# EasyEDA Pro project ProPrj_电刺激+主控_2026-05-06.epro, schematic Schematic1

## Sheets
1 主控模块: Assembly Variant: Basic; Board Name: Board1; Create Date: 2026-04-27; Page Name: P1; Project Name: 电刺激+主控; Schematic Name: Schematic1; Update Date: 2026-04-27; Company: 嘉立创EDA; Page Size: A4; Version: V1.0
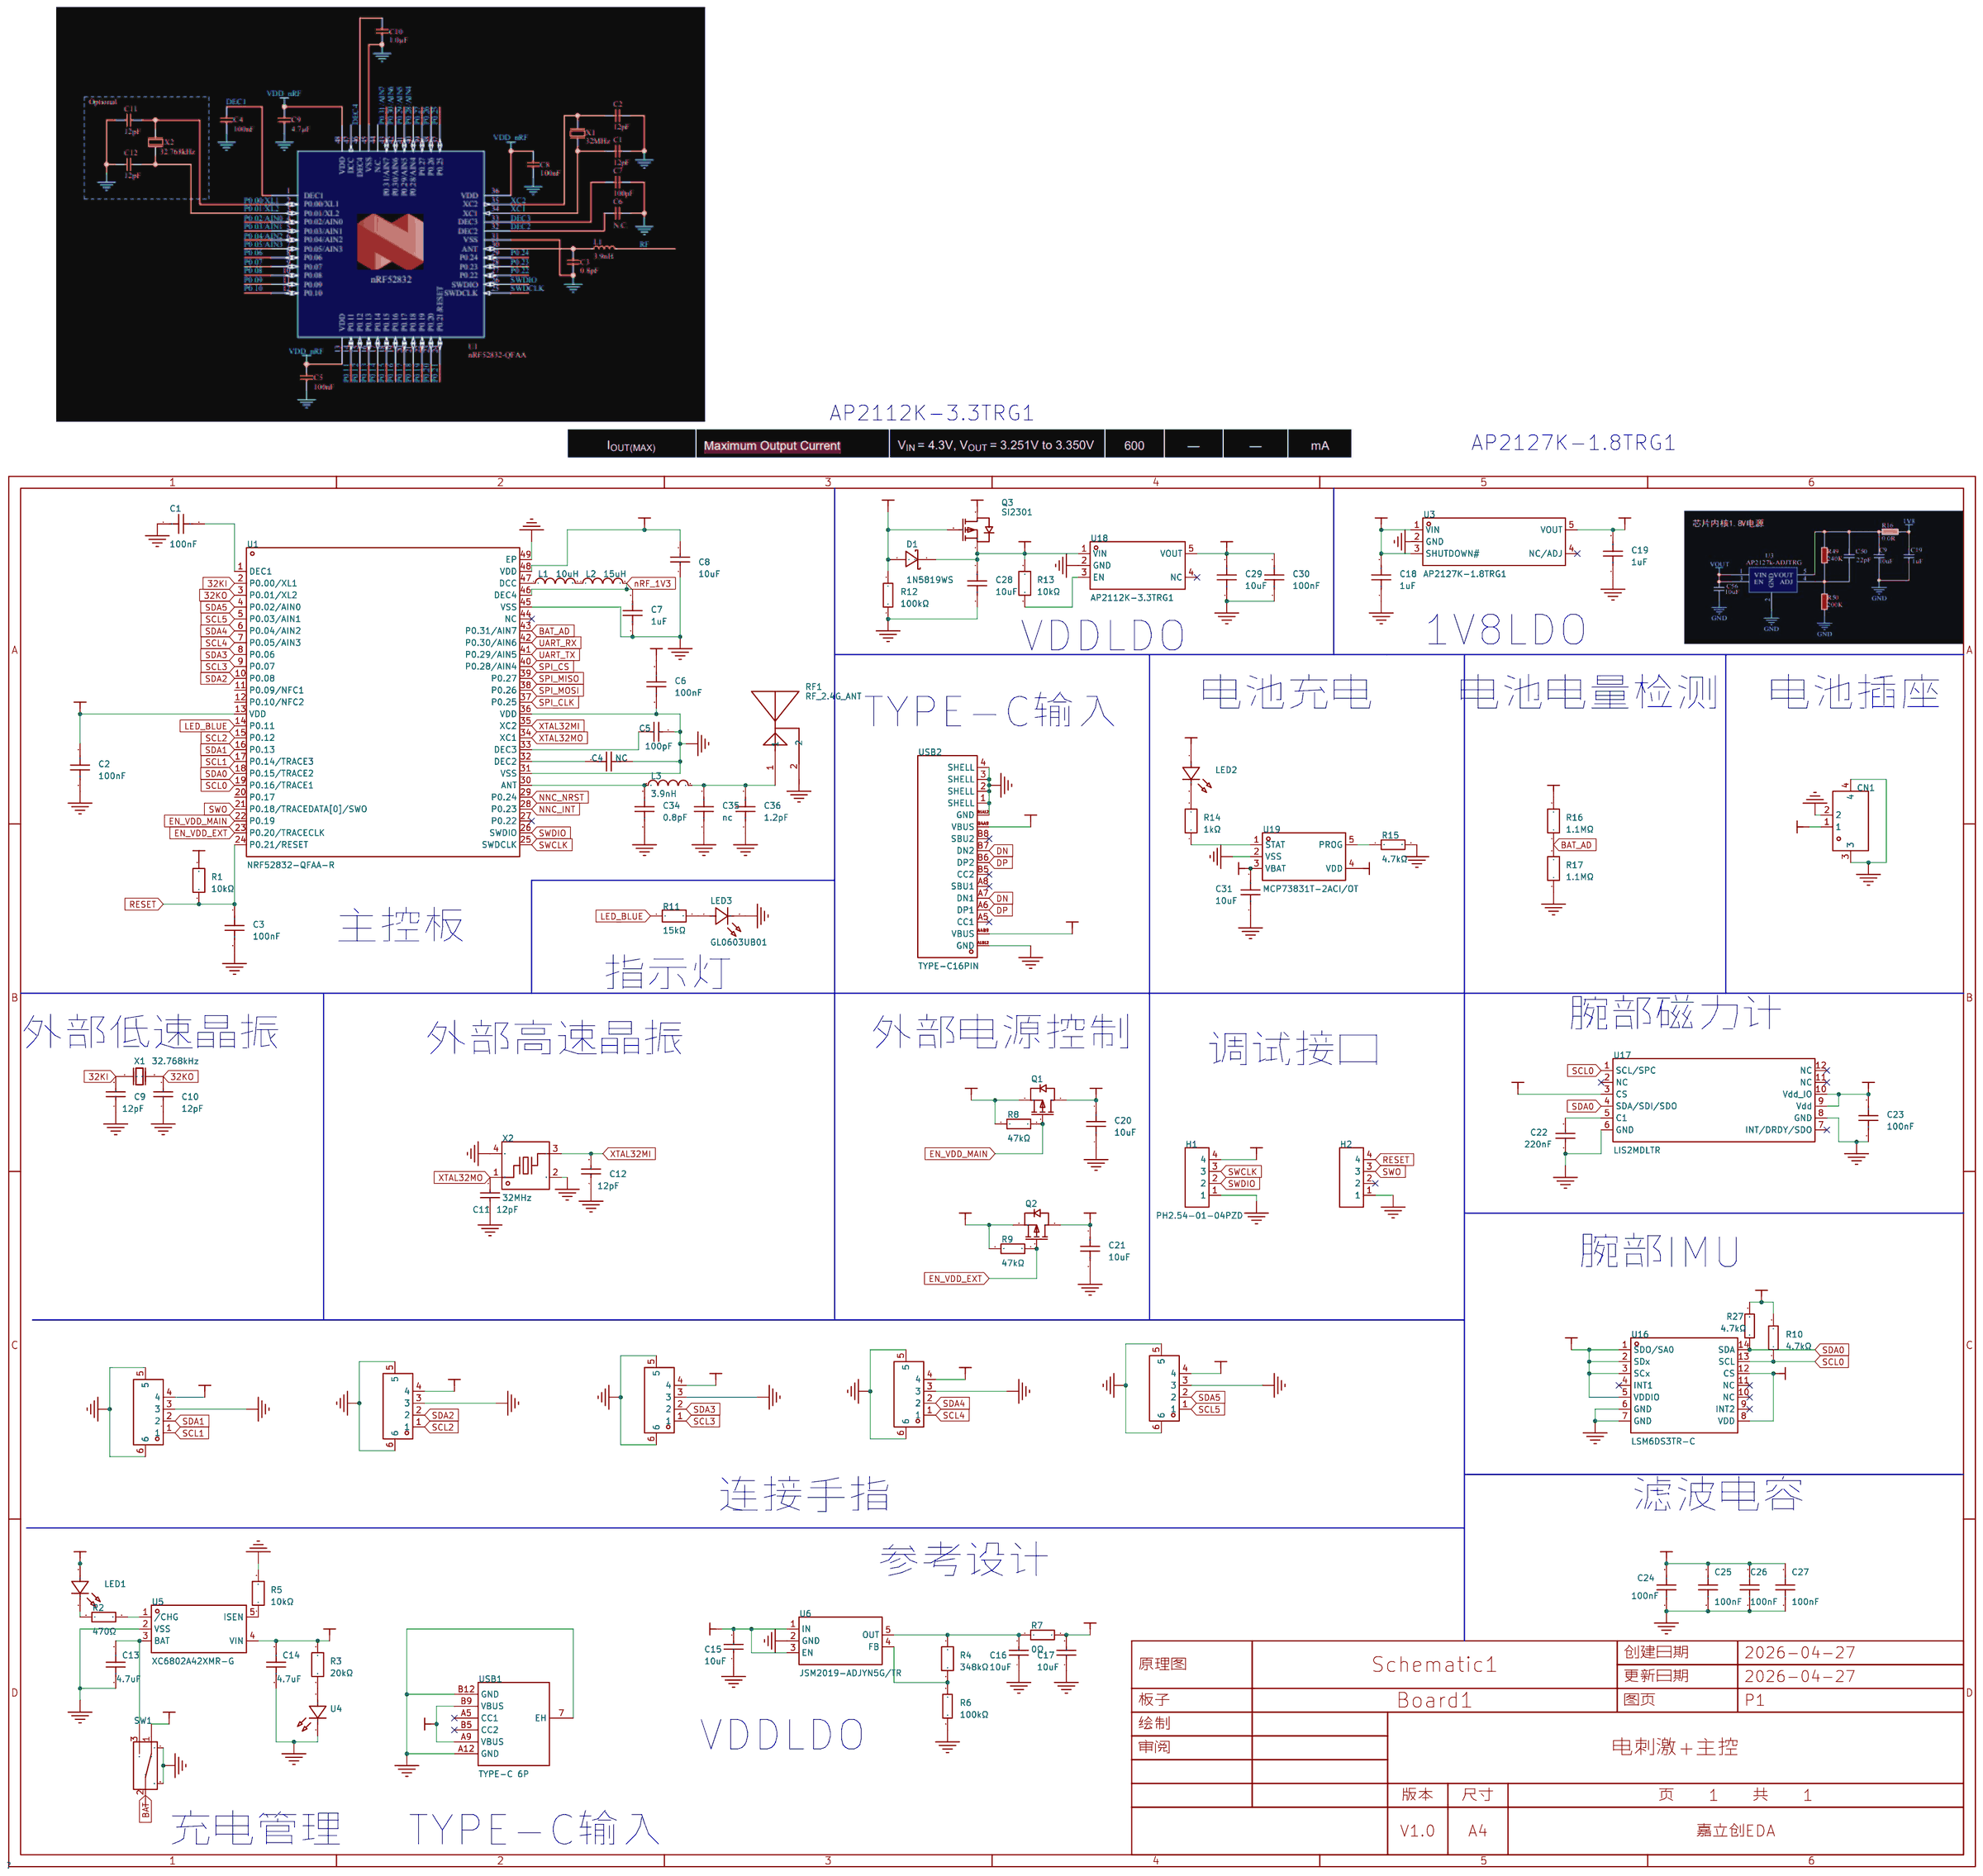
[diagram p0: 主控模块]
2 刺激模块: Page Name: P2
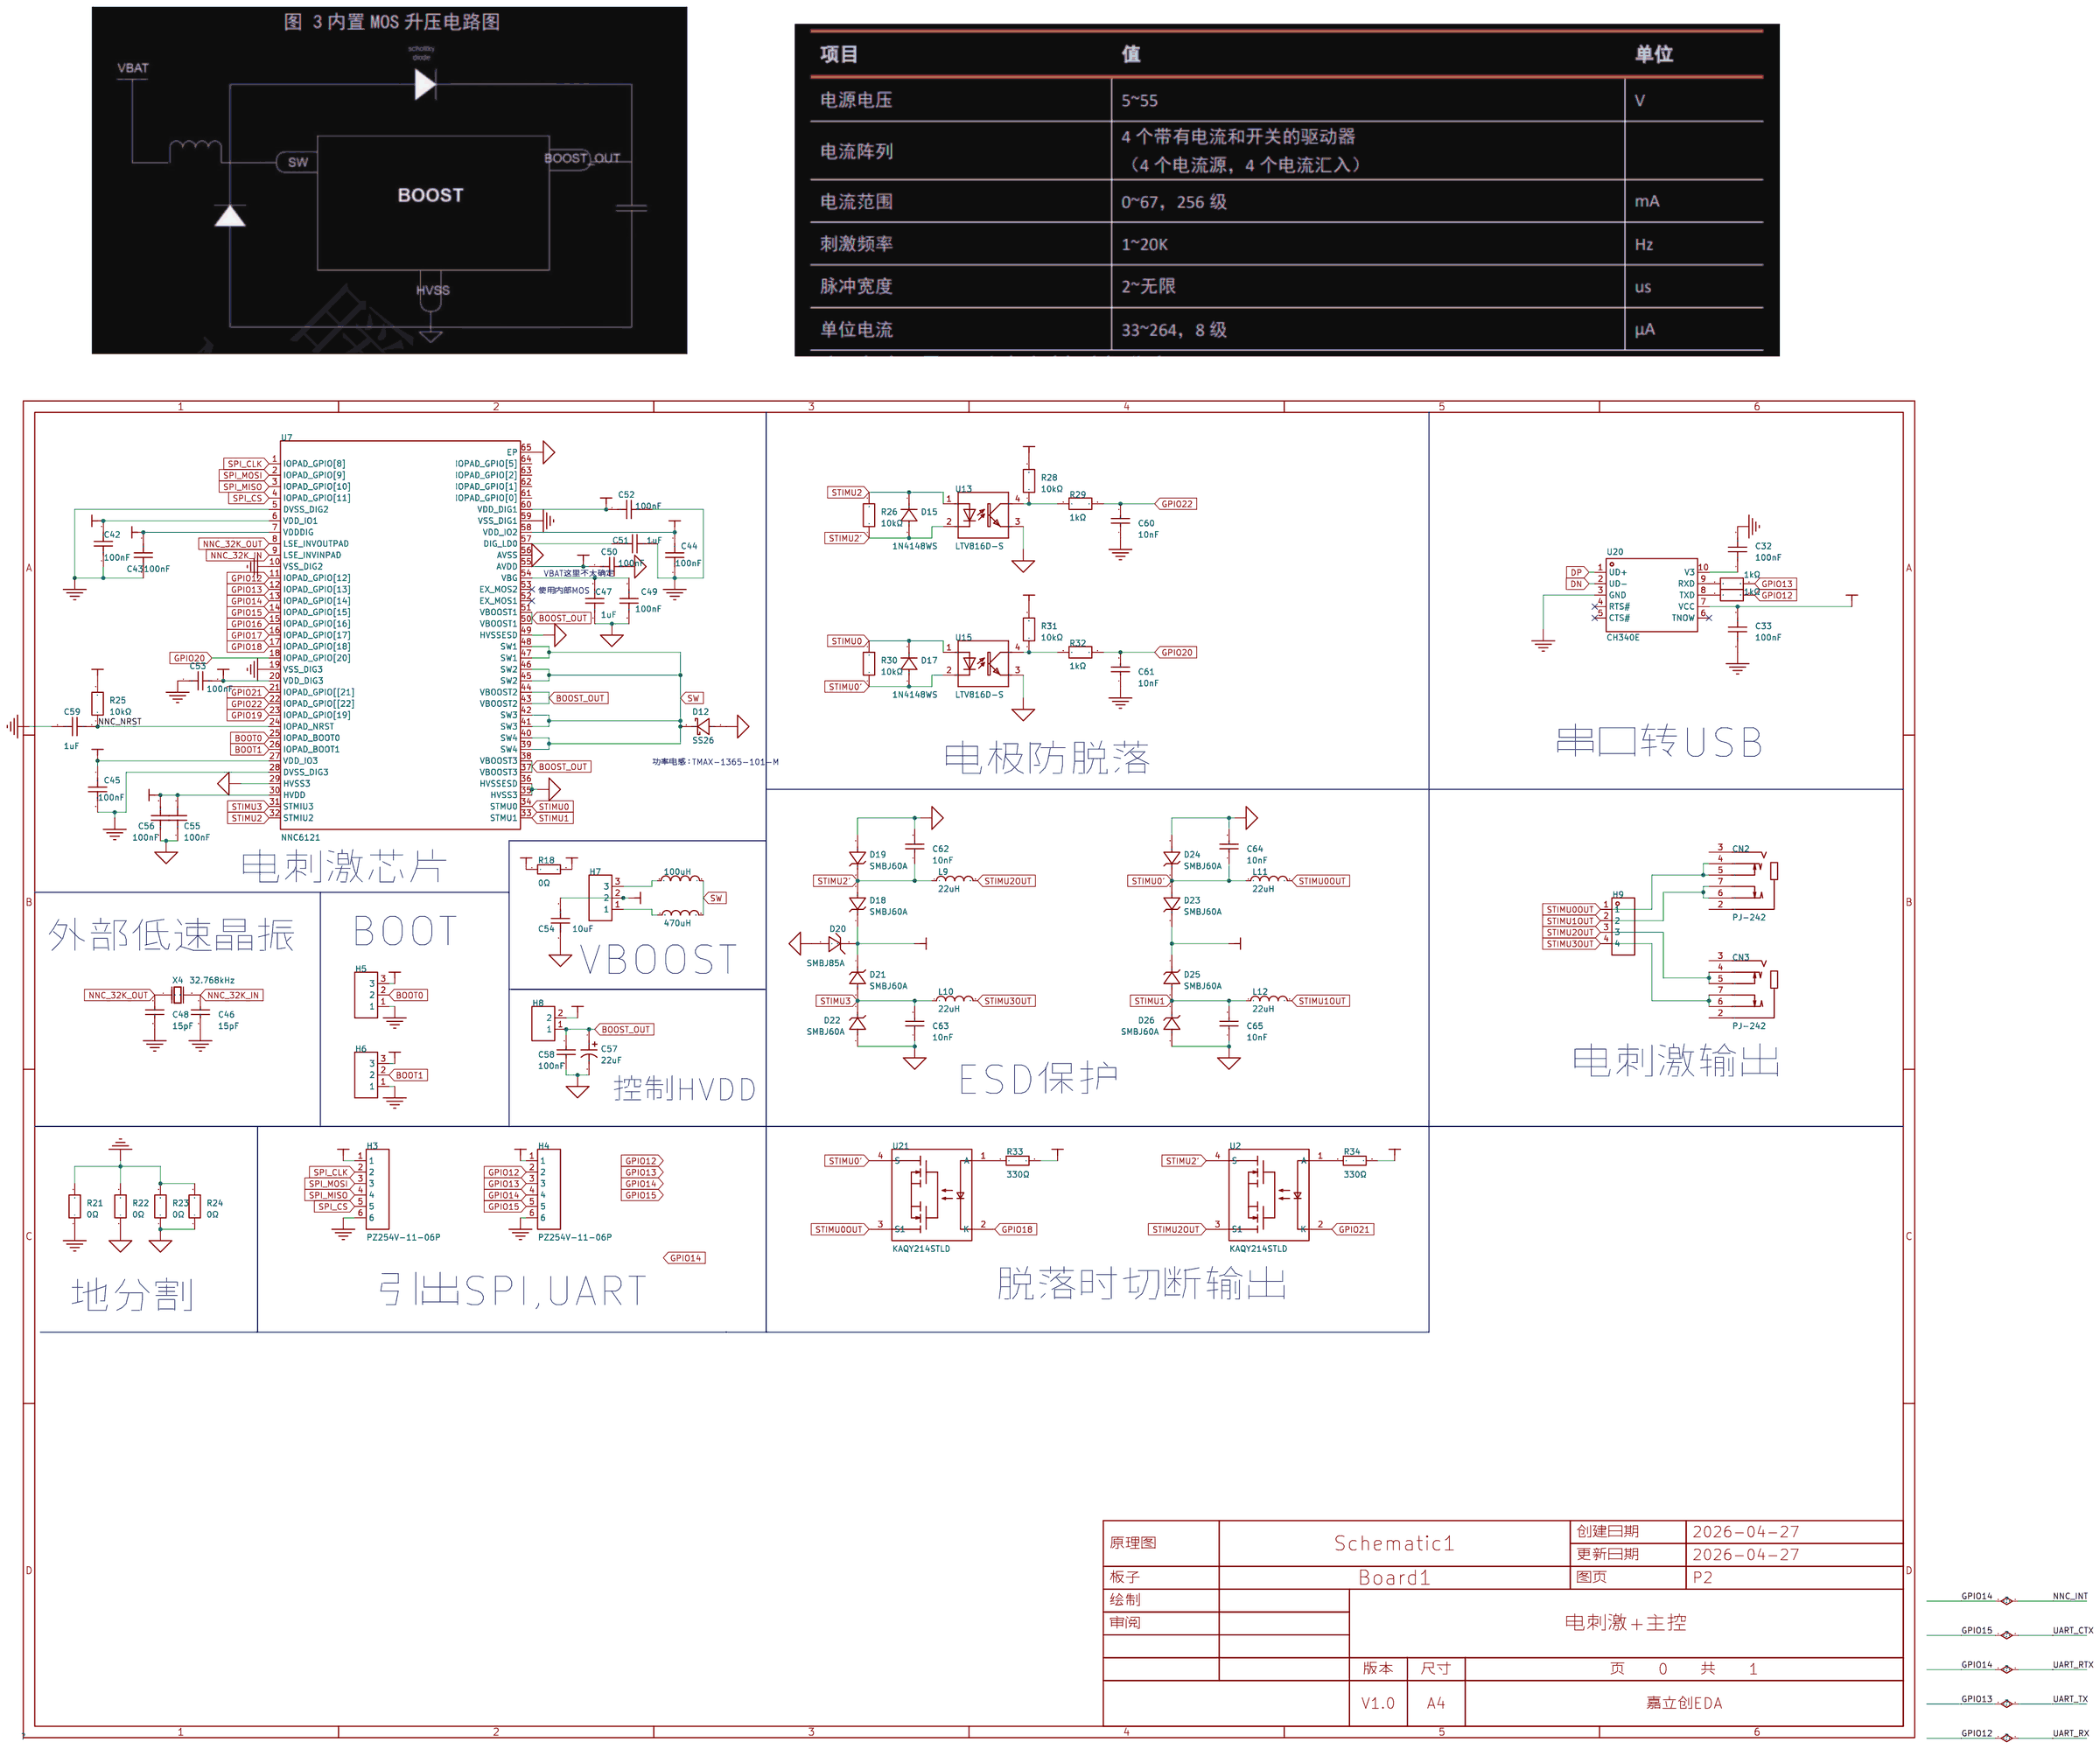
[diagram p1: 刺激模块]

## Parts
sheet 主控模块
C1  100nF  [C0402_NEW]
C2  100nF  [C0603]
C3  100nF  [C0603]
C4  NC  [C0805]
C5  100pF  [C0603]
C6  100nF  [C0603]
C7  1uF  [C0603]
C8  10uF  [C0402]
C9  12pF  [C0603]
C10  12pF  [C0603]
C11  12pF  [C0603]
C12  12pF  [C0603]
C13  4.7uF  [C0603]  (no BOM)
C14  4.7uF  [C0603]  (no BOM)
C15  10uF  [C0402]  (no BOM)
C16  10uF  [C0402]  (no BOM)
C17  10uF  [C0402]  (no BOM)
C18  1uF  [C0603]
C19  1uF  [C0603]
C20  10uF  [C0402]
C21  10uF  [C0402]
C22  220nF  [C0603]
C23  100nF  [C0603]
C24  100nF  [C0603]
C25  100nF  [C0603]
C26  100nF  [C0603]
C27  100nF  [C0603]
C28  10uF  [C0603]
C29  10uF  [C0603]
C30  100nF  [C0603]
C31  10uF  [C0603]
C34  0.8pF  [C0402]
C35  nc  [C0402]
C36  1.2pF  [C0402]
CN1  HC-1.25-2PWT  [CONN-SMD_2P-P1.25-HC-1.25-2PWT]
D1  1N5819WS  [SOD-323_L1.8-W1.3-LS2.5-RD]
H1  PH2.54-01-04PZD  [HDR-TH_4P-P2.54-V-M-1]
H2  PH2.54-01-04PZD  [HDR-TH_4P-P2.54-V-M-1]
L1  10uH  [L0603]
L2  15uH  [L0603]
L3  3.9nH  [L0402]
LED1  GL0603UR01  [LED0603-FD]  (no BOM)
LED2  GL0603UR01  [LED0603-FD]
LED3  GL0603UB01  [LED0603-RD_BLUE]
Q1  NX2301P,215  [SOT-23-3_L2.9-W1.3-P1.90-LS2.4-BR]
Q2  NX2301P,215  [SOT-23-3_L2.9-W1.3-P1.90-LS2.4-BR]
Q3  SI2301  [SOT-23-3_L2.9-W1.3-P1.90-LS2.4-BR]
R1  10kΩ  [R0603]
R2  470Ω  [R0603]  (no BOM)
R3  20kΩ  [R0603]  (no BOM)
R4  348kΩ  [R0603]  (no BOM)
R5  10kΩ  [R0603]  (no BOM)
R6  100kΩ  [R0603]  (no BOM)
R7  0Ω  [R0603]  (no BOM)
R8  47kΩ  [R0603]
R9  47kΩ  [R0603]
R10  4.7kΩ  [R0603]
R11  15kΩ  [R0603]
R12  100kΩ  [R0603]
R13  10kΩ  [R0603]
R14  1kΩ  [R0603]
R15  4.7kΩ  [R0603]
R16  1.1MΩ  [R0603]
R17  1.1MΩ  [R0603]
R27  4.7kΩ  [R0603]
RF1  RF_2.4G_ANT  [天线封装]
SW1  SS-12D02-VG4  [SW-TH_SS-12D02-VG4]  (no BOM)
U1  NRF52832-QFAA-R  [QFN-48_L6.0-W6.0-P0.40-BL-EP3.8]
U3  AP2127K-1.8TRG1  [SOT-23-5_L3.0-W1.7-P0.95-LS2.8-BR]
U4  PSC-1608U52GC-G4  [LED0603-RD_GREEN]  (no BOM)
U5  XC6802A42XMR-G  [SOT-25-5_L3.0-W1.8-P0.95-LS3.0-BL]  (no BOM)
U6  JSM2019-ADJYN5G/TR  [SOT-23-5_L2.9-W1.6-P0.95-LS2.8-BR]  (no BOM)
U8  WAFER-GH1.25-4PLB  [CONN-SMD_4P-P1.25_XUNPU_WAFER-GH1.25-4PLB]
U9  WAFER-GH1.25-4PLB  [CONN-SMD_4P-P1.25_XUNPU_WAFER-GH1.25-4PLB]
U10  WAFER-GH1.25-4PLB  [CONN-SMD_4P-P1.25_XUNPU_WAFER-GH1.25-4PLB]
U11  WAFER-GH1.25-4PLB  [CONN-SMD_4P-P1.25_XUNPU_WAFER-GH1.25-4PLB]
U14  WAFER-GH1.25-4PLB  [CONN-SMD_4P-P1.25_XUNPU_WAFER-GH1.25-4PLB]
U16  LSM6DS3TR-C  [LGA-14_L3.0-W2.5-P0.50-TL]
U17  LIS2MDLTR  [VLGA-12_L2.0-W2.0-P0.50-BL]
U18  AP2112K-3.3TRG1  [SOT-25-5_L2.9-W1.6-P0.95-LS2.8-BL]
U19  MCP73831T-2ACI/OT  [SOT-23-5_L3.0-W1.7-P0.95-LS2.8-BL]
USB1  TYPE-C 6P  [TYPE-C-SMD_TYPE-C-6P_1]  (no BOM)
USB2  TYPE-C16PIN  [USB-C-SMD_TYPE-C16PIN]
X1  32.768kHz  [OSC-SMD_2P-L3.2-W1.5]
X2  32MHz  [CRYSTAL-SMD_4P-L2.5-W2.0-BL]
sheet 刺激模块
C32  100nF  [C0603]
C33  100nF  [C0603]
C42  100nF  [C0603]
C43  100nF  [C0603]
C44  100nF  [C0603]
C45  100nF  [C0603]
C46  15pF  [C0603]
C47  1uF  [C0603]
C48  15pF  [C0603]
C49  100nF  [C0603]
C50  100nF  [C0603]
C51  1uF  [C0603]
C52  100nF  [C0603]
C53  100nF  [C0603]
C54  10uF  [C0805]
C55  100nF  [C0603]
C56  100nF  [C0603]
C57  22uF  [CAP-SMD_BD6.3-L6.6-W6.6-LS7.3-FD-H7.7]
C58  100nF  [C0805]
C59  1uF  [C0603]
C60  10nF  [C0603]
C61  10nF  [C0603]
C62  10nF  [C0603]
C63  10nF  [C0603]
C64  10nF  [C0603]
C65  10nF  [C0603]
CN2  PJ-242  [AUDIO-SMD_PJ-242_1]
CN3  PJ-242  [AUDIO-SMD_PJ-242_1]
D12  SS26  [SMA_L4.3-W2.6-LS5.0-FD]
D15  1N4148WS  [SOD-323_L1.8-W1.3-LS2.5-RD]
D17  1N4148WS  [SOD-323_L1.8-W1.3-LS2.5-RD]
D18  SMBJ60A  [SMB_L4.5-W3.7-LS5.4-RD]
D19  SMBJ60A  [SMB_L4.5-W3.7-LS5.4-RD]
D20  SMBJ85A  [SMB_L4.3-W3.6-LS5.3-RD]
D21  SMBJ60A  [SMB_L4.5-W3.7-LS5.4-RD]
D22  SMBJ60A  [SMB_L4.5-W3.7-LS5.4-RD]
D23  SMBJ60A  [SMB_L4.5-W3.7-LS5.4-RD]
D24  SMBJ60A  [SMB_L4.5-W3.7-LS5.4-RD]
D25  SMBJ60A  [SMB_L4.5-W3.7-LS5.4-RD]
D26  SMBJ60A  [SMB_L4.5-W3.7-LS5.4-RD]
H3  PZ254V-11-06P  [HDR-TH_6P-P2.54-V-M]
H4  PZ254V-11-06P  [HDR-TH_6P-P2.54-V-M]
H5  12251103CNG0S115001  [HDR-TH_3P-P2.54-V-M-1]
H6  12251103CNG0S115001  [HDR-TH_3P-P2.54-V-M-1]
H7  12251103CNG0S115001  [HDR-TH_3P-P2.54-V-M-1]
H8  PZ254V-11-02P  [HDR-TH_2P-P2.54-V-M]
H9  PZ254V-11-04P  [HDR-TH_4P-P2.54-V-M]
L8  100uH  [IND-SMD_L12.6-W13.5]
L9  22uH  [IND-SMD_L4.6-W4.1-A]
L10  22uH  [IND-SMD_L4.6-W4.1-A]
L11  22uH  [IND-SMD_L4.6-W4.1-A]
L12  22uH  [IND-SMD_L4.6-W4.1-A]
R18  0Ω  [R0603]
R19  1kΩ  [R0603]
R20  1kΩ  [R0603]
R21  0Ω  [R0805]
R22  0Ω  [R0805]
R23  0Ω  [R0805]
R24  0Ω  [R0805]
R25  10kΩ  [R0603]
R26  10kΩ  [R0603]
R28  10kΩ  [R0603]
R29  1kΩ  [R0603]
R30  10kΩ  [R0603]
R31  10kΩ  [R0603]
R32  1kΩ  [R0603]
R33  330Ω  [R0402]
R34  330Ω  [R0402]
U2  KAQY214STLD  [SOP-4_L3.9-W4.4-P2.54-LS7.0-BR]
U7  NNC6121  [QFN-64_L7.0-W7.0-P0.35-TL-EP4.0]
U12  470uH  [IND-SMD_L12.5-W12.5]
U13  LTV816D-S  [SOP-4_L6.5-W4.6-P2.54-LS10.2-BL]
U15  LTV816D-S  [SOP-4_L6.5-W4.6-P2.54-LS10.2-BL]
U20  CH340E  [MSOP-10_L3.0-W3.0-P0.50-LS5.0-BL]
U21  KAQY214STLD  [SOP-4_L3.9-W4.4-P2.54-LS7.0-BR]
X4  32.768kHz  [OSC-SMD_2P-L3.2-W1.5]

## Library data of the parts
C1-C3 C6 C23-C27 C30 C32 C33 C42-C45 C49 C50 C52 C53 = CGA0603X7R104K500JT: 容值:100nF;精度:±10%;额定电压:50V;温度系数:X7R;; LCSC Part Name: 100nF ±10% 50V; Supplier Part: C6119867; Manufacturer: HRE(芯声); Supplier Footprint: 0603; JLCPCB Part Class: Extended Part; Datasheet: https://item.szlcsc.com/datasheet/CGA0603X7R104K500JT/7062573.html; Supplier: LCSC; Tolerance: ±10%; Voltage Rating: 50V; Temperature Coefficient: X7R
C4 C54 = CGA0805X5R106K500MT: 容值:10uF;精度:±10%;额定电压:50V;温度系数:X5R;; LCSC Part Name: 10uF ±10% 50V; Supplier Part: C6119889; Manufacturer: HRE(芯声); Supplier Footprint: 0805; JLCPCB Part Class: Extended Part; Datasheet: https://item.szlcsc.com/datasheet/CGA0805X5R106K500MT/7062595.html; Supplier: LCSC; Tolerance: ±10%; Voltage Rating: 50V; Temperature Coefficient: X5R
C5 = CL10C101JB8NNNC: 容值:100pF;精度:±5%;额定电压:50V;温度系数:C0G;; LCSC Part Name: 100pF ±5% 50V; Supplier Part: C14858; Manufacturer: SAMSUNG(三星); Supplier Footprint: 0603; JLCPCB Part Class: Basic Part; Datasheet: https://item.szlcsc.com/datasheet/CL10C101JB8NNNC/15530.html; Supplier: LCSC; Tolerance: ±5%; Voltage Rating: 50V; Temperature Coefficient: C0G
C7 C18 C19 C47 C51 C59 = CGA0603X5R105K500JT: 容值:1uF;精度:±10%;额定电压:50V;温度系数:X5R;; LCSC Part Name: 1uF ±10% 50V; Supplier Part: C6119852; Manufacturer: HRE(芯声); Supplier Footprint: 0603; JLCPCB Part Class: Extended Part; Datasheet: https://item.szlcsc.com/datasheet/CGA0603X5R105K500JT/7062558.html; Supplier: LCSC; Tolerance: ±10%; Voltage Rating: 50V; Temperature Coefficient: X5R
C8 C15-C17 = CL05A106MQ5NUNC: 容值:10uF;精度:±20%;额定电压:6.3V;温度系数:X5R;; LCSC Part Name: 10uF ±20% 6.3V; Supplier Part: C15525; Manufacturer: SAMSUNG(三星); Supplier Footprint: 0402; JLCPCB Part Class: Basic Part; Datasheet: https://item.szlcsc.com/datasheet/CL05A106MQ5NUNC/16204.html; Supplier: LCSC; Tolerance: ±20%; Voltage Rating: 6.3V; Temperature Coefficient: X5R
C9-C12 = CL10C120JB8NNNC: 容值:12pF;精度:±5%;额定电压:50V;温度系数:C0G;; LCSC Part Name: 12pF ±5% 50V; Supplier Part: C38523; Manufacturer: SAMSUNG(三星); Supplier Footprint: 0603; JLCPCB Part Class: Basic Part; Datasheet: https://item.szlcsc.com/datasheet/CL10C120JB8NNNC/39506.html; Supplier: LCSC; Tolerance: ±5%; Voltage Rating: 50V; Temperature Coefficient: C0G
C13 C14 = CL10A475KO8NNNC: 容值:4.7uF;精度:±10%;额定电压:16V;温度系数:X5R;; LCSC Part Name: 4.7uF ±10% 16V; Supplier Part: C19666; Manufacturer: SAMSUNG(三星); Supplier Footprint: 0603; JLCPCB Part Class: Basic Part; Datasheet: https://item.szlcsc.com/datasheet/CL10A475KO8NNNC/20375.html; Supplier: LCSC; Tolerance: ±10%; Voltage Rating: 16V; Temperature Coefficient: X5R
C20 C21 = CGA0402X5R106M100GT: 容值:10uF;精度:±20%;额定电压:10V;温度系数:X5R;; LCSC Part Name: 10uF ±20% 10V; Supplier Part: C6119763; Manufacturer: HRE(芯声); Supplier Footprint: 0402; JLCPCB Part Class: Extended Part; Datasheet: https://item.szlcsc.com/datasheet/CGA0402X5R106M100GT/7062469.html; Supplier: LCSC; Tolerance: ±20%; Voltage Rating: 10V; Temperature Coefficient: X5R
C22 = CL10B224KA8NNNC: 容值:220nF;精度:±10%;额定电压:25V;温度系数:X7R;; LCSC Part Name: 220nF ±10% 25V; Supplier Part: C21120; Manufacturer: SAMSUNG(三星); Supplier Footprint: 0603; JLCPCB Part Class: Basic Part; Datasheet: https://item.szlcsc.com/datasheet/CL10B224KA8NNNC/21832.html; Supplier: LCSC; Tolerance: ±10%; Voltage Rating: 25V; Temperature Coefficient: X7R
C28 C29 C31 = CL10A106KP8NNNC: 容值:10uF;精度:±10%;额定电压:10V;温度系数:X5R;; LCSC Part Name: 10uF ±10% 10V; Supplier Part: C19702; Manufacturer: SAMSUNG(三星); Supplier Footprint: 0603; JLCPCB Part Class: Basic Part; Datasheet: https://item.szlcsc.com/datasheet/CL10A106KP8NNNC/20411.html; Supplier: LCSC; Tolerance: ±10%; Voltage Rating: 10V; Temperature Coefficient: X5R
C34-C36 = GJM1555C1HR80WB01D: 容值:0.8pF;额定电压:50V;温度系数:C0G;; LCSC Part Name: ±0.05pF 0.8pF 50V; Supplier Part: C88902; Manufacturer: muRata(村田); Supplier Footprint: 0402; JLCPCB Part Class: Extended Part; Datasheet: https://atta.szlcsc.com/upload/public/pdf/source/20241220/D0AFAF126C1929700C0BCD7972400352.pdf; Supplier: LCSC; Voltage Rating: 50V; Temperature Coefficient: C0G
CN1 = HC-1.25-2PWT: 插针结构:1x2P;间距:1.25mm;安装方式:卧贴;参考系列:PicoBlade(MX 1.25);总PIN数:2P;排数:1;每排PIN数:2;行距:-;额定电流:1A;触头材质:黄铜;触头镀层:锡;工作温度:-40℃~+105℃;; LCSC Part Name: 1x2P 间距:1.25mm 卧贴 系列:PicoBlade(MX 1.25); Supplier Part: C2845379; Manufacturer: HCTL(华灿天禄); Supplier Footprint: SMD,P=1.25mm,卧贴; JLCPCB Part Class: Extended Part; Datasheet: https://item.szlcsc.com/datasheet/HC-1.25-2PWT/3039060.html; Supplier: LCSC; Pins Structure: 1x2P; Pitch: 1.25mm; Mounting Type: 卧贴; Reference Series: PicoBlade(MX 1.25); Number of Pins: 2P; Number of Rows: 1; Number of PINs Per Row: 2; Current Rating: 1A; Contact Material: 黄铜; Contact Plating: 锡; Operating Temperature: -40℃~+105℃; Voltage Rating: 125V; Plastic Material: LCP; Flame Retardant Rating: UL94V-0; Supplementary Features: 辅助焊脚; Z-Height of the Board: 3.57mm; X-Length of Bottom Edge on Board (Spacing Line): 7.55mm; Y-Width of Bottom Edge on Board: 5.25mm
D1 = 1N5819WS_C191023: 正向压降(Vf):600mV@1A;直流反向耐压(Vr):40V;整流电流:1A;; LCSC Part Name: 电压:40V 电流:1A; Supplier Part: C191023; Manufacturer: Hottech(合科泰); Supplier Footprint: SOD-323; JLCPCB Part Class: Basic Part; Datasheet: https://item.szlcsc.com/datasheet/1N5819WS/213850.html; Supplier: LCSC; Voltage - Forward(Vf@If): 600mV@1A; Voltage - DC Reverse(Vr): 40V; Current - Rectified: 1A; Non-Repetitive Peak Forward Surge Current: 25A
H1 H2 = PH2.54-01-04PZD: 插针结构:1x4P;间距:2.54mm;圆针/方针:方针;安装方式:直插;排数:单排;总PIN位数:4P;配合针长度:6mm;塑高:2.5mm;端接针长度:3mm;触头材质:黄铜;工作温度:-40℃~+105℃;颜色:黑色;; LCSC Part Name: 1x4P 间距:2.54mm 方针 直插; Supplier Part: C7501582; Manufacturer: XUNPU(讯普); Supplier Footprint: 插件,P=2.54mm; JLCPCB Part Class: Extended Part; Datasheet: https://item.szlcsc.com/datasheet/PH2.54-01-04PZD/8584136.html; Supplier: LCSC; Pin Structure: 1x4P; Pitch: 2.54mm; Circluar Pins/Square Pins: 方针; Mounting Type: 直插; Number of Rows: 单排; Number of Pins: 4P; Length of Mating Pin: 6mm; Insulation Height: 2.5mm; Length of End Connection Pin: 3mm; Contact Material: 黄铜; Operating Temperature: -40℃~+105℃; Color: 黑色
L1 L2 = MLZ1608M100WT000: 电感值:10uH;精度:±20%;额定电流:-;饱和电流(Isat):90mA;直流电阻(DCR):1.05Ω;; LCSC Part Name: 10uH ±20% 90mA; Supplier Part: C76798; Manufacturer: TDK; Supplier Footprint: 0603; JLCPCB Part Class: Extended Part; Datasheet: https://item.szlcsc.com/datasheet/MLZ1608M100WT000/77925.html; Supplier: LCSC; Tolerance: ±20%; Current - Saturation (Isat): 90mA; DC Resistance(DCR): 1.05Ω; Frequency - Self Resonant: 2MHz
L3 = SDCL1005C3N9STDF: 电感值:3.9nH;精度:-;额定电流:300mA;饱和电流(Isat):-;直流电阻(DCR):200mΩ;; LCSC Part Name: ±0.3nH 3.9nH; Supplier Part: C14033; Manufacturer: Sunlord(顺络); Supplier Footprint: 0402; JLCPCB Part Class: Extended Part; Datasheet: https://item.szlcsc.com/datasheet/SDCL1005C3N9STDF/14690.html; Supplier: LCSC; Current Rating: 300mA; DC Resistance(DCR): 200mΩ; Q @ Frequency: 8@100MHz; Frequency - Self Resonant: 4GHz
LED1 LED2 = GL0603UR01: 发光颜色:红色;正向压降(Vf):2.4V;正向电流:20mA;波长:620nm~625nm;二极管配置:独立二极管;透镜颜色:无色透明透镜;发光强度:120mcd;发光角度:120°;载带方式:正贴;工作温度:-40℃~+85℃;; LCSC Part Name: 0603 红灯 高亮; Supplier Part: C51933292; Manufacturer: Guiguang light(桂光光电); Supplier Footprint: 0603; JLCPCB Part Class: Extended Part; Datasheet: https://item.szlcsc.com/datasheet/GL0603UR01/54645988.html; Supplier: LCSC; Illumination Color: 红色; Voltage - Forward(Vf): 2.4V; Forward Current: 20mA; Wavelength - Dominant: 620nm~625nm; Diode Configuration: 独立二极管; Lens Color: 无色透明透镜; Luminous Intensity: 120mcd; Viewing Angle: 120°; Mounting Style: 正贴; Operating Temperature: -40℃~+85℃
LED3 = GL0603UB01: 发光颜色:蓝色;正向压降(Vf):2.9V;正向电流:20mA;波长:460nm~469nm;二极管配置:独立二极管;透镜颜色:无色透明透镜;发光强度:72mcd;发光角度:120°;载带方式:正贴;工作温度:-40℃~+85℃;; LCSC Part Name: 0603 蓝灯 高亮; Supplier Part: C51933294; Manufacturer: Guiguang light(桂光光电); Supplier Footprint: 0603; JLCPCB Part Class: Extended Part; Datasheet: https://item.szlcsc.com/datasheet/GL0603UB01/54645990.html; Supplier: LCSC; Illumination Color: 蓝色; Voltage - Forward(Vf): 2.9V; Forward Current: 20mA; Wavelength - Dominant: 460nm~469nm; Diode Configuration: 独立二极管; Lens Color: 无色透明透镜; Luminous Intensity: 72mcd; Viewing Angle: 120°; Mounting Style: 正贴; Operating Temperature: -40℃~+85℃
Q1 Q2 = NX2301P,215: 数量:1个P沟道;漏源电压(Vdss):20V;连续漏极电流(Id):2A;导通电阻(RDS(on)):120mΩ@4.5V;耗散功率(Pd):400mW;阈值电压(Vgs(th)):1.1V@250uA;; LCSC Part Name: 1个P沟道 耐压:20V 电流:2A; Supplier Part: C191273; Manufacturer: Nexperia(安世); Supplier Footprint: SOT-23; JLCPCB Part Class: Extended Part; Datasheet: https://item.szlcsc.com/datasheet/NX2301P%252C215/214510.html; Supplier: LCSC; Number: 1个P沟道; Drain to Source Voltage: 20V; Current - Continuous Drain(Id): 2A; RDS(on): 120mΩ@4.5V; Pd - Power Dissipation: 400mW; Gate Threshold Voltage (Vgs(th)): 1.1V@250uA; Gate Charge(Qg): 6nC@4.5V; Input Capacitance(Ciss): 380pF; Reverse Transfer Capacitance (Crss@Vds): 115pF; Operating Temperature: -55℃~+150℃; Type: P沟道
Q3 = SI2301_C2891731: 数量:1个P沟道;漏源电压(Vdss):20V;连续漏极电流(Id):2.2A;导通电阻(RDS(on)):120mΩ@4.5V;耗散功率(Pd):700mW;阈值电压(Vgs(th)):1.5V@250uA;; LCSC Part Name: 1个P沟道 耐压:20V 电流:2.2A; Supplier Part: C2891731; Manufacturer: YONGYUTAI(永裕泰); Supplier Footprint: SOT-23; JLCPCB Part Class: Extended Part; Datasheet: https://item.szlcsc.com/datasheet/SI2301/3119650.html; Supplier: LCSC; Number: 1个P沟道; Drain to Source Voltage: 20V; Current - Continuous Drain(Id): 2.2A; RDS(on): 120mΩ@4.5V; Pd - Power Dissipation: 700mW; Gate Threshold Voltage (Vgs(th)): 1.5V@250uA; Input Capacitance(Ciss): 200pF@10V; Operating Temperature: -55℃~+150℃; Type: P沟道; Output Capacitance(Coss): 80pF
R1 R5 R13 R25 R26 R28 R30 R31 = FRC0603F1002TS: 电阻类型:厚膜电阻;阻值:10kΩ;精度:±1%;功率:100mW;工作电压:75V;温度系数:±100ppm/℃;; LCSC Part Name: 10kΩ ±1% 100mW 厚膜电阻; Supplier Part: C2906982; Manufacturer: FOJAN(富捷); Supplier Footprint: 0603; JLCPCB Part Class: Extended Part; Supplier: LCSC; Type: 厚膜电阻; Tolerance: ±1%; Power(Watts): 100mW; Voltage-Supply(Max): 75V; Temperature Coefficient: ±100ppm/℃; Operating Temperature: -55℃~+155℃
R2 = 0603WAF4700T5E: 电阻类型:厚膜电阻;阻值:470Ω;精度:±1%;功率:100mW;工作电压:75V;温度系数:±100ppm/℃;; LCSC Part Name: 470Ω ±1% 100mW 厚膜电阻; Supplier Part: C23179; Manufacturer: UNI-ROYAL(厚声); Supplier Footprint: 0603; JLCPCB Part Class: Basic Part; Datasheet: https://item.szlcsc.com/datasheet/0603WAF4700T5E/23906.html; Supplier: LCSC; Type: 厚膜电阻; Tolerance: ±1%; Power(Watts): 100mW; Voltage-Supply(Max): 75V; Temperature Coefficient: ±100ppm/℃; Operating Temperature: -55℃~+155℃
R3 = FRC0603F2002TS: 电阻类型:厚膜电阻;阻值:20kΩ;精度:±1%;功率:100mW;工作电压:75V;温度系数:±100ppm/℃;; LCSC Part Name: 20kΩ ±1% 100mW 厚膜电阻; Supplier Part: C2907011; Manufacturer: FOJAN(富捷); Supplier Footprint: 0603; JLCPCB Part Class: Extended Part; Supplier: LCSC; Type: 厚膜电阻; Tolerance: ±1%; Power(Watts): 100mW; Voltage-Supply(Max): 75V; Temperature Coefficient: ±100ppm/℃; Operating Temperature: -55℃~+155℃
R4 = FRC0603F3483TS: 电阻类型:厚膜电阻;阻值:348kΩ;精度:±1%;功率:100mW;工作电压:75V;温度系数:±100ppm/℃;; LCSC Part Name: 348kΩ ±1% 100mW 厚膜电阻; Supplier Part: C2930094; Manufacturer: FOJAN(富捷); Supplier Footprint: 0603; JLCPCB Part Class: Extended Part; Supplier: LCSC; Type: 厚膜电阻; Tolerance: ±1%; Power(Watts): 100mW; Voltage-Supply(Max): 75V; Temperature Coefficient: ±100ppm/℃; Operating Temperature: -55℃~+155℃
R6 R12 = 0603WAF1003T5E: 电阻类型:厚膜电阻;阻值:100kΩ;精度:±1%;功率:100mW;工作电压:75V;温度系数:±100ppm/℃;; LCSC Part Name: 100kΩ ±1% 100mW 厚膜电阻; Supplier Part: C25803; Manufacturer: UNI-ROYAL(厚声); Supplier Footprint: 0603; JLCPCB Part Class: Basic Part; Datasheet: https://item.szlcsc.com/datasheet/0603WAF1003T5E/26546.html; Supplier: LCSC; Type: 厚膜电阻; Tolerance: ±1%; Power(Watts): 100mW; Voltage-Supply(Max): 75V; Temperature Coefficient: ±100ppm/℃; Operating Temperature: -55℃~+155℃
R7 R18 = 0603WAF0000T5E: 电阻类型:厚膜电阻;阻值:0Ω;精度:±1%;功率:100mW;工作电压:75V;温度系数:-;; LCSC Part Name: 0Ω ±1% 100mW 厚膜电阻; Supplier Part: C21189; Manufacturer: UNI-ROYAL(厚声); Supplier Footprint: 0603; JLCPCB Part Class: Basic Part; Datasheet: https://item.szlcsc.com/datasheet/0603WAF0000T5E/21903.html; Supplier: LCSC; Type: 厚膜电阻; Tolerance: ±1%; Power(Watts): 100mW; Voltage-Supply(Max): 75V; Operating Temperature: -55℃~+155℃
R8 R9 = 0603WAF4702T5E: 电阻类型:厚膜电阻;阻值:47kΩ;精度:±1%;功率:100mW;工作电压:75V;温度系数:±100ppm/℃;; LCSC Part Name: 47kΩ ±1% 100mW 厚膜电阻; Supplier Part: C25819; Manufacturer: UNI-ROYAL(厚声); Supplier Footprint: 0603; JLCPCB Part Class: Basic Part; Datasheet: https://item.szlcsc.com/datasheet/0603WAF4702T5E/26562.html; Supplier: LCSC; Type: 厚膜电阻; Tolerance: ±1%; Power(Watts): 100mW; Voltage-Supply(Max): 75V; Temperature Coefficient: ±100ppm/℃; Operating Temperature: -55℃~+155℃
R10 R15 R27 = 0603WAF4701T5E: 电阻类型:厚膜电阻;阻值:4.7kΩ;精度:±1%;功率:100mW;工作电压:75V;温度系数:±100ppm/℃;; LCSC Part Name: 4.7kΩ ±1% 100mW 厚膜电阻; Supplier Part: C23162; Manufacturer: UNI-ROYAL(厚声); Supplier Footprint: 0603; JLCPCB Part Class: Basic Part; Datasheet: https://item.szlcsc.com/datasheet/0603WAF4701T5E/23889.html; Supplier: LCSC; Type: 厚膜电阻; Tolerance: ±1%; Power(Watts): 100mW; Voltage-Supply(Max): 75V; Temperature Coefficient: ±100ppm/℃; Operating Temperature: -55℃~+155℃
R11 = FRC0603F1502TS: 电阻类型:厚膜电阻;阻值:15kΩ;精度:±1%;功率:100mW;工作电压:75V;温度系数:±100ppm/℃;; LCSC Part Name: 15kΩ ±1% 100mW 厚膜电阻; Supplier Part: C2906995; Manufacturer: FOJAN(富捷); Supplier Footprint: 0603; JLCPCB Part Class: Extended Part; Supplier: LCSC; Type: 厚膜电阻; Tolerance: ±1%; Power(Watts): 100mW; Voltage-Supply(Max): 75V; Temperature Coefficient: ±100ppm/℃; Operating Temperature: -55℃~+155℃
R14 R19 R20 R29 R32 = FRC0603F1001TS: 电阻类型:厚膜电阻;阻值:1kΩ;精度:±1%;功率:100mW;工作电压:75V;温度系数:±100ppm/℃;; LCSC Part Name: 1kΩ ±1% 100mW 厚膜电阻; Supplier Part: C2907002; Manufacturer: FOJAN(富捷); Supplier Footprint: 0603; JLCPCB Part Class: Extended Part; Supplier: LCSC; Type: 厚膜电阻; Tolerance: ±1%; Power(Watts): 100mW; Voltage-Supply(Max): 75V; Temperature Coefficient: ±100ppm/℃; Operating Temperature: -55℃~+155℃
R16 R17 = FRC0603F1104TS: 电阻类型:厚膜电阻;阻值:1.1MΩ;精度:±1%;功率:100mW;工作电压:75V;温度系数:±100ppm/℃;; LCSC Part Name: 1.1MΩ ±1% 100mW 厚膜电阻; Supplier Part: C2930138; Manufacturer: FOJAN(富捷); Supplier Footprint: 0603; JLCPCB Part Class: Extended Part; Supplier: LCSC; Type: 厚膜电阻; Tolerance: ±1%; Power(Watts): 100mW; Voltage-Supply(Max): 75V; Temperature Coefficient: ±100ppm/℃; Operating Temperature: -55℃~+155℃
RF1 = RF_2.4G_ANT
SW1 = SS-12D02-VG4_C136719: 电路结构:单刀双掷;安装方式:直插;额定电流:-;额定电压:-;工作寿命:5千次;; LCSC Part Name: 直插双档 滑动开关; Supplier Part: C136719; Manufacturer: 韩国韩荣; Supplier Footprint: 插件; JLCPCB Part Class: Extended Part; Datasheet: https://item.szlcsc.com/datasheet/SS-12D02-VG4/148035.html; Supplier: LCSC; Circuit: 单刀双掷; Actuator Style: 矩形柱状; Termination Style: PC引脚; Switch Height: 8.7mm; Mounting Type: 直插; Life: 5千次; Operating Temperature: -25℃~+70℃
U1 = NRF52832-QFAA-R: 频率范围:-;接口类型:I2C；UART；SPI;应用领域:IoT；蓝牙;数据速率:2Mbps;灵敏度:-96dBm;典型应用频率:2.4GHz;; LCSC Part Name: 2.4 GHz收发器，蓝牙低功耗模式; Supplier Part: C77540; Manufacturer: NORDIC; Supplier Footprint: QFN-48-EP(6x6); JLCPCB Part Class: Extended Part; Datasheet: https://item.szlcsc.com/datasheet/NRF52832-QFAA-R/78669.html; Supplier: LCSC; Interface: I2C；UART；SPI; Voltage - Supply: 1.7V~3.6V; Applications: IoT；蓝牙; Output Power: 4dBm; Data Rate: 2Mbps; Current Of Transmitting: 5.3mA; Sensitivity: -96dBm; Receive Current: 5.4mA; Typical Application Frequency: 2.4GHz; Operating Temperature: -40℃~+85℃; Type: 收发器
U3 = AP2127K-1.8TRG1: 输出类型:固定;工作电压:6V;输出电压:1.8V;输出电流:300mA;电源纹波抑制比(PSRR):68dB@(1kHz);输出极性:正极;; LCSC Part Name: 输入6V 输出1.8V~1.8V 300mA; Supplier Part: C151375; Manufacturer: DIODES(美台); Supplier Footprint: SOT-23-5; JLCPCB Part Class: Extended Part; Datasheet: https://item.szlcsc.com/datasheet/AP2127K-1.8TRG1/162715.html; Supplier: LCSC; Output Type: 固定; Voltage - Supply: 6V; Output Voltage: 1.8V; Output Current: 300mA; Power Supply Rejection Ratio (PSRR): 68dB@(1kHz); Voltage Dropout: 600mV@(300mA); standby current: 60uA; Noise: 60uVrms; Features: 过流保护；带使能；过热保护; Operating Temperature: -40℃~+85℃@(Ta); Output Configuration: 正极; Number of Outputs: 1
U4 = PSC-1608U52GC-G4: 发光颜色:绿色;正向压降(Vf):3.1V;功率:66mW;正向电流:10mA;波长:517nm~527nm;透镜颜色:无色透明透镜;发光强度:780mcd;发光角度:130°;工作温度:-40℃~+85℃;; LCSC Part Name: 钻孔1608低亮绿灯; Supplier Part: C22371297; Manufacturer: HONGLITRONIC(鸿利光电); Supplier Footprint: 0603; JLCPCB Part Class: Extended Part; Datasheet: https://item.szlcsc.com/datasheet/PSC-1608U52GC-G4/23857064.html; Supplier: LCSC; Illumination Color: 绿色; Voltage - Forward(Vf): 3.1V; Power(Watts): 66mW; Forward Current: 10mA; Wavelength - Dominant: 517nm~527nm; Lens Color: 无色透明透镜; Luminous Intensity: 780mcd; Viewing Angle: 130°; Operating Temperature: -40℃~+85℃
U5 = XC6802A42XMR-G: 工作电压:4.25V~6V;最大充电电流:800mA;电池类型:锂电池;电池节数:1;; LCSC Part Name: 800mA单节锂离子和锂聚合物电池线性充电器IC，恒流/恒压; Supplier Part: C160463; Manufacturer: TOREX(特瑞仕); Supplier Footprint: SOT-25; JLCPCB Part Class: Extended Part; Datasheet: https://item.szlcsc.com/datasheet/XC6802A42XMR-G/171843.html; Supplier: LCSC; The Chip Type: 充电芯片; Voltage - Supply: 4.25V~6V; Charge Current - Max: 800mA; Charging Saturation Voltage: 4.2V; Type of Battery: 锂电池; Number of Cells: 1; Operating Temperature: -40℃~+85℃; Battery Temperature Detection: 不支持; Supply Current (Iq): 15uA
U6 = JSM2019-ADJYN5G/TR: 输出类型:可调;工作电压:5.5V;输出电流:300mA;电源纹波抑制比(PSRR):80dB@(100Hz);输出极性:正极;; LCSC Part Name: 300mA 5.5V; Supplier Part: C22447123; Manufacturer: JSMSEMI(杰盛微); Supplier Footprint: SOT-23-5; JLCPCB Part Class: Extended Part; Datasheet: https://item.szlcsc.com/datasheet/JSM2019-ADJYN5G%252FTR/24102045.html; Supplier: LCSC; Output Type: 可调; Voltage - Supply: 5.5V; Output Current: 300mA; Power Supply Rejection Ratio (PSRR): 80dB@(100Hz); standby current: 2uA; Features: 过流保护；热关断; Operating Temperature: -40℃~+85℃@(Ta); Output Configuration: 正极; Number of Outputs: 1
U8-U11 U14 = WAFER-GH1.25-4PLB: 插针结构:1x4P;间距:1.25mm;安装方式:立贴;参考系列:GH;总PIN数:4P;排数:1;每排PIN数:4;行距:-;额定电流:1A;触头材质:黄铜;触头镀层:锡;工作温度:-25℃~+85℃;; LCSC Part Name: 1x4P 间距:1.25mm 立贴 系列:GH; Supplier Part: C3029370; Manufacturer: XUNPU(讯普); Supplier Footprint: SMD,P=1.25mm; JLCPCB Part Class: Extended Part; Datasheet: https://item.szlcsc.com/datasheet/WAFER-GH1.25-4PLB/3561382.html; Supplier: LCSC; Pins Structure: 1x4P; Pitch: 1.25mm; Mounting Type: 立贴; Reference Series: GH; Number of Pins: 4P; Number of Rows: 1; Number of PINs Per Row: 4; Current Rating: 1A; Contact Material: 黄铜; Contact Plating: 锡; Operating Temperature: -25℃~+85℃; Voltage Rating: 125V; Plastic Material: LCP; Supplementary Features: 辅助焊脚; Color: 米色; Z-Height of the Board: 4.2mm; X-Length of Bottom Edge on Board (Spacing Line): 8.25mm; Y-Width of Bottom Edge on Board: 4.95mm
U16 = LSM6DS3TR-C: 传感器类型:加速度计陀螺仪;接口类型:I2C；SPI;; LCSC Part Name: IMU-惯性测量单元; Supplier Part: C967633; Manufacturer: ST(意法半导体); Supplier Footprint: LGA-14(2.5x3); JLCPCB Part Class: Extended Part; Datasheet: https://item.szlcsc.com/datasheet/LSM6DS3TR-C/1054343.html; Supplier: LCSC; Accelerometer Sensing Axis: X,Y,Z; Acceleration Measurement Range (MAX): ±16g; Gyroscope Sensing Axis: X,Y,Z; Gyroscope Measurement Range (MAX): ±2000dps; Sensor Type: 加速度计陀螺仪; Interface: I2C；SPI; Voltage - Supply: 1.71V~3.6V; Cache Size: 4KB; Operating Temperature: -40℃~+85℃
U17 = LIS2MDLTR: 磁传感器、数字输出、50高斯磁场动态范围、超低功耗、高性能、3轴磁力计; LCSC Part Name: 霍尔效应开关; Supplier Part: C919695; Manufacturer: ST(意法半导体); Supplier Footprint: LGA-12(2x2); JLCPCB Part Class: Extended Part; Datasheet: https://item.szlcsc.com/datasheet/LIS2MDLTR/998419.html; Supplier: LCSC; Magnetic Sensing Range(X,Y): ±5mT; Magnetic Sensing Range(Z): ±5mT; Output bit: 16bit; Interface Type: SPI；I2C; Voltage - Supply: 1.71V~3.6V; Current - Supply: 200uA; Operating Temperature: -40℃~+85℃
U18 = AP2112K-3.3TRG1: 输出类型:固定;工作电压:6V;输出电压:3.3V;输出电流:600mA;电源纹波抑制比(PSRR):65dB@(1kHz);输出极性:正极;; LCSC Part Name: 输入6V 输出3.3V 600mA; Supplier Part: C51118; Manufacturer: DIODES(美台); Supplier Footprint: SOT-25-5; JLCPCB Part Class: Extended Part; Datasheet: https://item.szlcsc.com/datasheet/AP2112K-3.3TRG1/52131.html; Supplier: LCSC; Output Type: 固定; Voltage - Supply: 6V; Output Voltage: 3.3V; Output Current: 600mA; Power Supply Rejection Ratio (PSRR): 65dB@(1kHz); Voltage Dropout: 250mV@(600mA); standby current: 55uA; Noise: 50uVrms; Features: 带使能；过热保护；过流保护; Operating Temperature: -40℃~+85℃@(Ta); Output Configuration: 正极; Number of Outputs: 1
U19 = MCP73831T-2ACI/OT: 工作电压:3.75V~6V;最大充电电流:550mA;电池类型:锂电池;电池节数:1;; LCSC Part Name: 单节锂离子/锂聚合物充电管理控制器; Supplier Part: C424093; Manufacturer: MICROCHIP(美国微芯); Supplier Footprint: SOT-23-5; JLCPCB Part Class: Extended Part; Datasheet: https://item.szlcsc.com/datasheet/MCP73831T-2ACI%252FOT/417116.html; Supplier: LCSC; The Chip Type: 充电芯片; Voltage - Supply: 3.75V~6V; Charge Current - Max: 550mA; Charging Saturation Voltage: 4.2V; Type of Battery: 锂电池; Number of Cells: 1; Operating Temperature: -40℃~+85℃; Battery Temperature Detection: 不支持; Supply Current (Iq): 53uA
USB1 = TYPE-C 6P: 连接器类型:Type-C;协议标准:-;公母:母;安装方式:卧贴;触点数量:6P;端口数量:1;额定电流 - 电源:3A;工作温度:-40℃~+85℃;; LCSC Part Name: 6P卧贴母座; Supplier Part: C456012; Manufacturer: SHOU HAN(首韩); Supplier Footprint: SMD; JLCPCB Part Class: Extended Part; Datasheet: https://item.szlcsc.com/datasheet/TYPE-C%25206P/458819.html; Supplier: LCSC; Connector Type: Type-C; Gender: 母; Mounting Type: 卧贴; Number of Contacts: 6P; Number of Ports: 1; Current Rating-Power: 3A; Voltage Rating: 5V; Connect-Disconnect Life: 3千次; Detection color: 黑色; Operating Temperature: -40℃~+85℃
USB2 = TYPE-C16PIN: 连接器类型:Type-C;协议标准:-;公母:母;安装方式:卧贴;触点数量:16P;端口数量:1;额定电流 - 电源:3A;工作温度:-40℃~+85℃;; LCSC Part Name: 16P卧贴母座; Supplier Part: C393939; Manufacturer: SHOU HAN(首韩); Supplier Footprint: SMD; JLCPCB Part Class: Extended Part; Datasheet: https://item.szlcsc.com/datasheet/TYPE-C16PIN/372551.html; Supplier: LCSC; Connector Type: Type-C; Gender: 母; Mounting Type: 卧贴; Number of Contacts: 16P; Number of Ports: 1; Current Rating-Power: 3A; Voltage Rating: 30V; Connect-Disconnect Life: 1万次; Detection color: 黑色; Operating Temperature: -40℃~+85℃
X1 X4 = CM315D32768DZFT: 晶振类型:-;频率:32.768kHz;常温频差:±20ppm;外接负载电容:12.5pF;; LCSC Part Name: 32.768kHz ±20ppm 12.5pF; Supplier Part: C182057; Manufacturer: CITIZEN; Supplier Footprint: SMD3215-2P; JLCPCB Part Class: Extended Part; Datasheet: https://atta.szlcsc.com/upload/public/pdf/source/20180224/C182057_15194369676281363999.pdf; Supplier: LCSC; Normal temperature Frequency Tolerance: ±20ppm; External load capacitor: 12.5pF; Equivalent Series Resistance (ESR): 70kΩ; Operating Temperature: -40℃~+85℃
X2 = S2232000121040: 晶振类型:贴片晶振;频率:32MHz;常温频差:±10ppm;负载电容:12pF;; LCSC Part Name: 32MHz ±10ppm 12pF; Supplier Part: C1508946; Manufacturer: JGHC(晶光华); Supplier Footprint: SMD2520-4P; JLCPCB Part Class: Extended Part; Datasheet: https://atta.szlcsc.com/upload/public/pdf/source/20200102/C479187_D94AAA14F8877AC0B7C204DEF1552113.pdf; Supplier: LCSC; Crystal Type: 贴片晶振; Normal temperature Frequency Tolerance: ±10ppm; Load Capacitor: 12pF; Equivalent Series Resistance (ESR): 40Ω; Operating Temperature: -40℃~+85℃
C46 C48 = CL10C150JB8NNNC: 容值:15pF;精度:±5%;额定电压:50V;温度系数:C0G;; LCSC Part Name: 15pF ±5% 50V; Supplier Part: C1644; Manufacturer: SAMSUNG(三星); Supplier Footprint: 0603; JLCPCB Part Class: Basic Part; Datasheet: https://item.szlcsc.com/datasheet/CL10C150JB8NNNC/1996.html; Supplier: LCSC; Tolerance: ±5%; Voltage Rating: 50V; Temperature Coefficient: C0G
C55 C56 = CL10B104KC8NNNC: 容值:100nF;精度:±10%;额定电压:100V;温度系数:X7R;; LCSC Part Name: 100nF ±10% 100V; Supplier Part: C15725; Manufacturer: SAMSUNG(三星); Supplier Footprint: 0603; JLCPCB Part Class: Extended Part; Datasheet: https://item.szlcsc.com/datasheet/CL10B104KC8NNNC/16407.html; Supplier: LCSC; Tolerance: ±10%; Voltage Rating: 100V; Temperature Coefficient: X7R
C57 = JVJ100V22M6x8: 容值:22uF;精度:±20%;额定电压:100V;纹波电流:60mA@120Hz;; LCSC Part Name: 22uF ±20% 100V; Supplier Part: C46550391; Manufacturer: JIERR(捷而瑞); Supplier Footprint: SMD,D6.3xL7.7mm; JLCPCB Part Class: Extended Part; Datasheet: https://item.szlcsc.com/datasheet/JVJ100V22M6x8/48680085.html; Supplier: LCSC; Tolerance: ±20%; Voltage Rating: 100V; Ripple Current: 60mA@120Hz; Diameter: 6.3mm; Height - Seated (Max): 7.7mm; Lifetime: 2000hrs@105℃; Operating Temperature: -55℃~+105℃
C58 = CL21B104KCFNNNE: 容值:100nF;精度:±10%;额定电压:100V;温度系数:X7R;; LCSC Part Name: 100nF ±10% 100V; Supplier Part: C28233; Manufacturer: SAMSUNG(三星); Supplier Footprint: 0805; JLCPCB Part Class: Basic Part; Datasheet: https://item.szlcsc.com/datasheet/CL21B104KCFNNNE/28983.html; Supplier: LCSC; Tolerance: ±10%; Voltage Rating: 100V; Temperature Coefficient: X7R
C60-C65 = CC0603KRX7R9BB103: 容值:10nF;精度:±10%;额定电压:50V;温度系数:X7R;; LCSC Part Name: 10nF ±10% 50V; Supplier Part: C100042; Manufacturer: YAGEO(国巨); Supplier Footprint: 0603; JLCPCB Part Class: Extended Part; Datasheet: https://item.szlcsc.com/datasheet/CC0603KRX7R9BB103/101256.html; Supplier: LCSC; Tolerance: ±10%; Voltage Rating: 50V; Temperature Coefficient: X7R
CN2 CN3 = PJ-242_C431536: 连接器类型:2.5mm耳机座;额定电流:500mA;额定电压:30V;触头材质:铜;触头镀层:-;工作温度:-;; LCSC Part Name: PJ-242-6P双柱镀金散装; Supplier Part: C431536; Manufacturer: SHOU HAN(首韩); Supplier Footprint: SMD; JLCPCB Part Class: Extended Part; Datasheet: https://item.szlcsc.com/datasheet/PJ-242/427893.html; Supplier: LCSC; Connector Type: 2.5mm耳机座; Current Rating: 500mA; Voltage Rating (Max): 30V; Contact Material: 铜
D12 = SS26_C7420363: 二极管配置:独立式;正向压降(Vf):700mV@2A;直流反向耐压(Vr):60V;整流电流:2A;; LCSC Part Name: 电压:60V 电流:2A; Supplier Part: C7420363; Manufacturer: R+O(宏嘉诚); Supplier Footprint: SMA(DO-214AC); JLCPCB Part Class: Extended Part; Datasheet: https://item.szlcsc.com/datasheet/SS26/8397185.html; Supplier: LCSC; Diode Configuration: 独立式; Voltage - Forward(Vf@If): 700mV@2A; Voltage - DC Reverse(Vr): 60V; Current - Rectified: 2A; Reverse Leakage Current (Ir): 200uA@60V; Operating Junction Temperature Range: -55℃~+150℃; Non-Repetitive Peak Forward Surge Current: 50A
D15 D17 = 1N4148WS_C727111: 二极管配置:独立式;正向压降(Vf):1.25V@150mA;直流反向耐压(Vr):100V;整流电流:300mA;反向恢复时间(Trr):8ns;; LCSC Part Name: 100V 300mA; Supplier Part: C727111; Manufacturer: TWGMC(迪嘉); Supplier Footprint: SOD-323; JLCPCB Part Class: Extended Part; Datasheet: https://item.szlcsc.com/datasheet/1N4148WS/774216.html; Supplier: LCSC; Diode Configuration: 独立式; Voltage - Forward(Vf@If): 1.25V@150mA; Voltage - DC Reverse(Vr): 100V; Current - Rectified: 300mA; Pd - Power Dissipation: 400mW; Reverse Leakage Current (Ir): 1uA; Reverse Recovery Time (trr): 8ns; Operating Junction Temperature Range: -55℃~+150℃@(Tj); Non-Repetitive Peak Forward Surge Current: 4A
D18 D19 D21-D26 = SMBJ60A_C49066953: 极性:单向;反向截止电压(Vrwm):60V;钳位电压:96.8V;峰值脉冲电流(Ipp):6.2A;峰值脉冲功率(Ppp):600W;击穿电压:73.7V;; LCSC Part Name: 单向TVS 60V截止 峰值浪涌电流：6.2A; Supplier Part: C49066953; Manufacturer: R+O(宏嘉诚); Supplier Footprint: SMB(DO-214AA); JLCPCB Part Class: Extended Part; Datasheet: https://item.szlcsc.com/datasheet/SMBJ60A/51438149.html; Supplier: LCSC; Polarity: 单向; Reverse Stand-Off Voltage (Vrwm): 60V; Clamping Voltage: 96.8V; Peak Pulse Current (Ipp): 6.2A; Peak Pulse Power Dissipation (Ppp): 600W; Voltage - Breakdown: 73.7V; Reverse Leakage Current (Ir): 5uA; Number of Channels: 单路; Operating Temperature: -55℃~+150℃; level of protection: IEC 61000-4-2; Type: TVS
D20 = SMBJ85A_C49066958: 极性:单向;反向截止电压(Vrwm):85V;钳位电压:137V;峰值脉冲电流(Ipp):4.38A;峰值脉冲功率(Ppp):600W;击穿电压:104V;; LCSC Part Name: 单向TVS 85V截止 峰值浪涌电流：4.38A; Supplier Part: C49066958; Manufacturer: R+O(宏嘉诚); Supplier Footprint: SMB(DO-214AA); JLCPCB Part Class: Extended Part; Datasheet: https://item.szlcsc.com/datasheet/SMBJ85A/51438154.html; Supplier: LCSC; Polarity: 单向; Reverse Stand-Off Voltage (Vrwm): 85V; Clamping Voltage: 137V; Peak Pulse Current (Ipp): 4.38A; Peak Pulse Power Dissipation (Ppp): 600W; Voltage - Breakdown: 104V; Reverse Leakage Current (Ir): 5uA; Number of Channels: 单路; Operating Temperature: -55℃~+150℃; level of protection: IEC 61000-4-2; Type: TVS
H3 H4 = PZ254V-11-06P: 插针结构:1x6P;间距:2.54mm;行距:-;圆针/方针:方针;安装方式:直插;排数:单排;总PIN位数:6P;额定电流:3A;额定电压:250V;配合针长度:6mm;塑高:2.5mm;端接针长度:3mm;触头材质:黄铜;触头镀层:-;工作温度:-40℃~+105℃;颜色:黑色;; LCSC Part Name: 1x6P 间距:2.54mm 方针 直插; Supplier Part: C492405; Manufacturer: XFCN(兴飞); Supplier Footprint: 插件,P=2.54mm; JLCPCB Part Class: Extended Part; Datasheet: https://item.szlcsc.com/datasheet/PZ254V-11-06P/502961.html; Supplier: LCSC; Pin Structure: 1x6P; Pitch: 2.54mm; Circluar Pins/Square Pins: 方针; Mounting Type: 直插; Number of Rows: 单排; Number of Pins: 6P; Current Rating: 3A; Voltage Rating (Max): 250V; Length of Mating Pin: 6mm; Insulation Height: 2.5mm; Length of End Connection Pin: 3mm; Contact Material: 黄铜; Operating Temperature: -40℃~+105℃; Color: 黑色
H5-H7 = 12251103CNG0S115001: 插针结构:1x3P;间距:2.54mm;行距:-;圆针/方针:方针;安装方式:直插;排数:单排;总PIN位数:3P;额定电流:3A;额定电压:-;配合针长度:6mm;塑高:2.5mm;端接针长度:3mm;触头材质:黄铜;触头镀层:-;工作温度:-40℃~+105℃;颜色:黑色;; LCSC Part Name: 1x3P 间距:2.54mm 方针 直插; Supplier Part: C429954; Manufacturer: JILN(锦凌); Supplier Footprint: 插件,P=2.54mm; JLCPCB Part Class: Extended Part; Datasheet: https://item.szlcsc.com/datasheet/12251103CNG0S115001/426406.html; Supplier: LCSC; Pin Structure: 1x3P; Pitch: 2.54mm; Circluar Pins/Square Pins: 方针; Mounting Type: 直插; Number of Rows: 单排; Number of Pins: 3P; Current Rating: 3A; Length of Mating Pin: 6mm; Insulation Height: 2.5mm; Length of End Connection Pin: 3mm; Contact Material: 黄铜; Operating Temperature: -40℃~+105℃; Color: 黑色
H8 = PZ254V-11-02P: 插针结构:1x2P;间距:2.54mm;行距:-;圆针/方针:方针;安装方式:直插;排数:单排;总PIN位数:2P;额定电流:3A;额定电压:250V;配合针长度:6mm;塑高:2.5mm;端接针长度:3mm;触头材质:黄铜;触头镀层:-;工作温度:-40℃~+105℃;颜色:黑色;; LCSC Part Name: 1x2P 间距:2.54mm 方针 直插; Supplier Part: C492401; Manufacturer: XFCN(兴飞); Supplier Footprint: 插件,P=2.54mm; JLCPCB Part Class: Extended Part; Datasheet: https://item.szlcsc.com/datasheet/PZ254V-11-02P/502957.html; Supplier: LCSC; Pin Structure: 1x2P; Pitch: 2.54mm; Circluar Pins/Square Pins: 方针; Mounting Type: 直插; Number of Rows: 单排; Number of Pins: 2P; Current Rating: 3A; Voltage Rating (Max): 250V; Length of Mating Pin: 6mm; Insulation Height: 2.5mm; Length of End Connection Pin: 3mm; Contact Material: 黄铜; Operating Temperature: -40℃~+105℃; Color: 黑色
H9 = PZ254V-11-04P: 插针结构:1x4P;间距:2.54mm;行距:-;圆针/方针:方针;安装方式:直插;排数:单排;总PIN位数:4P;额定电流:3A;额定电压:250V;配合针长度:6mm;塑高:2.5mm;端接针长度:3mm;触头材质:-;工作温度:-40℃~+105℃;颜色:黑色;; LCSC Part Name: 1x4P 间距:2.54mm 方针 直插; Supplier Part: C2691448; Manufacturer: XFCN(兴飞); Supplier Footprint: 插件,P=2.54mm; JLCPCB Part Class: Extended Part; Datasheet: https://item.szlcsc.com/datasheet/PZ254V-11-04P/2801085.html; Supplier: LCSC; Pin Structure: 1x4P; Pitch: 2.54mm; Circluar Pins/Square Pins: 方针; Mounting Type: 直插; Number of Rows: 单排; Number of Pins: 4P; Current Rating: 3A; Voltage Rating (Max): 250V; Length of Mating Pin: 6mm; Insulation Height: 2.5mm; Length of End Connection Pin: 3mm; Operating Temperature: -40℃~+105℃; Color: 黑色
L8 = FXL1360-101-M: 电感值:100uH;精度:±20%;额定电流:2.5A;饱和电流(Isat):3.5A;类型:一体成型电感;; LCSC Part Name: 100uH ±20% 3.5A; Supplier Part: C526033; Manufacturer: cjiang(长江微电); Supplier Footprint: SMD,12.6x13.5mm; JLCPCB Part Class: Extended Part; Datasheet: https://atta.szlcsc.com/upload/public/pdf/source/20240426/3189EA8206330E2108542F9E34E540E7.pdf; Supplier: LCSC; Tolerance: ±20%; Rated Current: 2.5A; Saturation Current (Isat): 3.5A; DC Resistance (DCR): 200mΩ; Type: 一体成型电感
L9-L12 = SRG0420-220-M: 电感值:22uH;精度:±20%;额定电流:1.2A;饱和电流(Isat):1.3A;类型:一体成型电感;; LCSC Part Name: 22μH ±20% 1.3A; Supplier Part: C53462921; Manufacturer: JIERR(捷而瑞); Supplier Footprint: SMD,4.6x4.1mm; JLCPCB Part Class: Extended Part; Datasheet: https://item.szlcsc.com/datasheet/SRG0420-220-M/56628166.html; Supplier: LCSC; Tolerance: ±20%; Current Rating: 1.2A; Current - Saturation(Isat): 1.3A; DC Resistance(DCR): 500mΩ; Type: 一体成型电感
R21-R24 = RE0805FAR000: 电阻类型:合金电阻;阻值:0Ω;精度:±1%;功率:500mW;温度系数:±50ppm/℃;安装方式:贴片;; LCSC Part Name: 0Ω 0.5W 0805 ±1%; Supplier Part: C51934133; Manufacturer: JIERR(捷而瑞); Supplier Footprint: 0805; JLCPCB Part Class: Extended Part; Datasheet: https://item.szlcsc.com/datasheet/RE0805FAR000/54649545.html; Supplier: LCSC; Type: 合金电阻; Tolerance: ±1%; Power(Watts): 500mW; Temperature Coefficient: ±50ppm/℃; Mounting Type: 贴片
R33 R34 = 0402WGF3300TCE: 电阻类型:厚膜电阻;阻值:330Ω;精度:±1%;功率:62.5mW;工作电压:50V;温度系数:±100ppm/℃;; LCSC Part Name: 330Ω ±1% 62.5mW 厚膜电阻; Supplier Part: C25104; Manufacturer: UNI-ROYAL(厚声); Supplier Footprint: 0402; JLCPCB Part Class: Basic Part; Datasheet: https://item.szlcsc.com/datasheet/0402WGF3300TCE/25847.html; Supplier: LCSC; Type: 厚膜电阻; Tolerance: ±1%; Power(Watts): 62.5mW; Voltage-Supply(Max): 50V; Temperature Coefficient: ±100ppm/℃; Operating Temperature: -55℃~+155℃
U2 U21 = KAQY214STLD: 触点形式:SPST-NO(1 Form A);正向压降(Vf):1.2V;负载电压:400V;连续负载电流:130mA;导通电阻:20Ω;; LCSC Part Name: 1 Form A(SPSTNO) 负载AC,DC 负载电压400V; Supplier Part: C113331; Manufacturer: Cosmo(冠西); Supplier Footprint: SOP-4-2.54mm; JLCPCB Part Class: Extended Part; Datasheet: https://item.szlcsc.com/datasheet/KAQY214STLD/114566.html; Supplier: LCSC; Contact Form: SPST-NO(1 Form A); Voltage - Forward(Vf): 1.2V; Load Voltage: 400V; Load Current: 130mA; RDS(on): 20Ω; Isolation Voltage(Vrms): 1.5kV; Turn-on time: 300us; Turn-off time: 100us
U7 = NNC6121: NNC6121芯片是一款集成了32MHz ARM处理器的双通道神经刺激芯片，能够实现DC到50kHz的任意恒流源波形输出，可以覆盖传统的正弦波/方波/三角波及各种调制波形，可应用于体外神经/肌肉电刺激等众多领域。电压最高为单向60V  刺激脉宽大于10us，量程：1~67mA，系统OSC：HSI_32M +-2%，产品FLASH空间：28KB; LCSC Part Name: 高集成可编程刺激芯片; Supplier Part: C42396791; Manufacturer: NANOCHAP(暖芯迦); Supplier Footprint: QFN-64L(7x7); JLCPCB Part Class: Extended Part; Datasheet: https://item.szlcsc.com/datasheet/NNC6121/44345719.html; Supplier: LCSC
U12 = HX CYH125-470UH: 电感值:470uH;精度:±20%;额定电流:1.16A;直流电阻(DCR):299mΩ;; LCSC Part Name: 470uH ±20%; Supplier Part: C7587717; Manufacturer: hanxia(韩下); Supplier Footprint: SMD,12.5x12.5mm; JLCPCB Part Class: Extended Part; Datasheet: https://atta.szlcsc.com/upload/public/pdf/source/20230829/13E323C062B0572C4C1B0E504D820596.pdf; Supplier: LCSC; Tolerance: ±20%; Rated Current: 1.16A; DC Resistance (DCR): 299mΩ
U13 U15 = LTV816D-S: 输入类型:DC;正向压降(Vf):1.2V;输出电流:50mA;隔离电压(Vrms):5kV;直流反向耐压(Vr):6V;负载电压:80V;输出通道数:1;集射极饱和电压(VCE(sat)):100mV@1mA,20mA;; LCSC Part Name: DC输入 隔离电压(rms):5000V; Supplier Part: C364141; Manufacturer: UMW(友台半导体); Supplier Footprint: SOP-4-2.54mm; JLCPCB Part Class: Extended Part; Datasheet: https://item.szlcsc.com/datasheet/LTV816D-S/338453.html; Supplier: LCSC; Input type: DC; Output Type: 光电三极管; Voltage - Forward(Vf): 1.2V; Output Current: 50mA; Isolation Voltage(Vrms): 5kV; Reverse Voltage: 6V; Load Voltage: 80V; Number of Outputs: 1; Vce Saturation(VCE(sat)): 100mV@1mA,20mA; Rise time: 4us; Fall time: 3us; Operating Temperature: -55℃~+110℃; Current Transfer Ratio (CTR) Minimum: 50%; Current Transfer Ratio (CTR) Maximum/Saturation Value: 600%; Total Power Dissipation(Pd): 200mW; Forward Current(If): 60mA
U20 = CH340E: 应用功能:收发器;USB协议版本:USB 2.0;数据速率:2Mbps;; LCSC Part Name: USB转串口芯片CH340; Supplier Part: C99652; Manufacturer: WCH(南京沁恒); Supplier Footprint: MSOP-10; JLCPCB Part Class: Extended Part; Datasheet: https://item.szlcsc.com/datasheet/CH340E/100866.html; Supplier: LCSC; Applications Function: 收发器; USB Protocol: USB 2.0; Voltage - Supply: 3.3V；5V; Data Rate: 2Mbps; Current - Supply: 20mA; Supply Current (Iq): 150uA

## Nets
1V8: C19.2 C43.2 C52.1 C53.2 U3.5(VOUT) U7.7(VDDDIG) U7.20(VDD_DIG3) U7.60(VDD_DIG1)
AGND: C47.1 C49.2 C50.2 R23.1 R24.1 U7.56(AVSS)
DGND: C1.2 C2.2 C3.2 C4.2 C5.2 C6.1 C7.1 C8.1 C9.1 C10.1 C11.1 C12.1 C14.1 C20.1 C21.1 C22.1 C23.1 C24.1 C25.1 C26.1 C27.1 C34.1 C35.1 C36.1 C42.1 C43.1 C44.2 C45.2 C46.1 C48.1 C51.1 C52.2 C53.1 C59.2 C60.1 C61.1 H1.1 H2.1 H3.6 H4.6 H5.1 H6.1 LED3.1(K) R5.2 R17.1 R21.1 RF1.2 SW1.4 SW1.5 U1.31(VSS) U1.36(VDD) U1.45(VSS) U1.49(EP) U4.1(K) U6.2(GND) U7.5(DVSS_DIG2) U7.10(VSS_DIG2) U7.19(VSS_DIG3) U7.28(DVSS_DIG3) U7.59(VSS_DIG1) U8.3 U9.3 U10.3 U11.3 U14.3 U16.6(GND) U16.7(GND) U17.6(GND) U17.8(GND) USB1.7(EH) USB1.A12(GND) USB1.B12(GND) X2.2(GND) X2.4(GND)
GND: C13.1 C15.1 C16.1 C17.1 C18.1 C19.1 C28.1 C29.1 C30.1 C31.1 C32.2 C33.1 CN1.2 CN1.3 CN1.4 R6.1 R12.1 R15.2 R21.2 R22.2 R23.2 R24.2 U3.2(GND) U5.2(VSS) U8.5 U8.6 U9.5 U9.6 U10.5 U10.6 U11.5 U11.6 U14.5 U14.6 U18.2(GND) U19.2(VSS) U20.3(GND) USB2.1(SHELL) USB2.2(SHELL) USB2.3(SHELL) USB2.4(SHELL) USB2.A1B12(GND) USB2.B1A12(GND)
VBAT: C15.2 C31.2 C50.1 CN1.1 Q3.3(D) R16.2 SW1.1 U6.1(IN) U6.3(EN) U7.55(AVDD) U19.3(VBAT)
VBUS: C14.2 C33.2 D1.2(A) LED1.1(A) LED2.1(A) Q3.1(G) R3.2 R12.2 U5.4(VIN) U19.4(VDD) U20.7(VCC) USB1.A9(VBUS) USB1.B9(VBUS) USB2.A4B9(VBUS) USB2.B4A9(VBUS)
VDD: C2.1 C6.2 C8.2 C17.2 C18.2 C29.2 C30.2 C42.2 C44.1 C45.1 H1.4 H3.1 H4.1 H5.3 H6.3 Q1.2(S) Q2.2(S) R1.2 R7.2 R8.1 R9.1 R25.2 R28.2 R31.2 R33.2 R34.2 U1.13(VDD) U1.48(VDD) U3.1(VIN) U3.3(SHUTDOWN#) U7.6(VDD_IO1) U7.27(VDD_IO3) U7.58(VDD_IO2) U18.5(VOUT)
VDD_EXT: C21.2 Q2.3(D) U8.4 U9.4 U10.4 U11.4 U14.4
VDD_MAIN: C20.2 C23.2 C24.2 C25.2 C26.2 C27.2 Q1.3(D) R10.2 R27.2 U16.1(SDO/SA0) U16.2(SDx) U16.3(SCx) U16.5(VDDIO) U16.8(VDD) U16.12(CS) U17.3(CS) U17.9(Vdd) U17.10(Vdd_IO)
32KI: C9.2 U1.2(P0.00/XL1) X1.1(OSC1)
32KO: C10.2 U1.3(P0.01/XL2) X1.2(OSC2)
BAT: SW1.2
BAT_AD: R16.1 R17.2 U1.43(P0.31/AIN7)
BOOST_OUT: C57.1 C58.2 H8.1 U7.37(VBOOST3) U7.38(VBOOST3) U7.43(VBOOST2) U7.44(VBOOST2) U7.50(VBOOST1) U7.51(VBOOST1)
BOOT0: H5.2 U7.25(IOPAD_BOOT0)
BOOT1: H6.2 U7.26(IOPAD_BOOT1)
DN: U20.2(UD-) USB2.A7(DN1) USB2.B7(DN2)
DP: U20.1(UD+) USB2.A6(DP1) USB2.B6(DP2)
EN_VDD_EXT: Q2.1(G) R9.2 U1.23(P0.20/TRACECLK)
EN_VDD_MAIN: Q1.1(G) R8.2 U1.22(P0.19)
GPIO12: H4.2 R20.2 U1.42(P0.30/AIN6) U7.11(IOPAD_GPIO[12])
GPIO13: H4.3 R19.2 U1.41(P0.29/AIN5) U7.12(IOPAD_GPIO[13])
GPIO14: H4.4 U1.28(P0.23) U7.13(IOPAD_GPIO[14])
GPIO15: H4.5 U7.14(IOPAD_GPIO[15])
GPIO16: U7.15(IOPAD_GPIO[16])
GPIO17: U7.16(IOPAD_GPIO[17])
GPIO18: U7.17(IOPAD_GPIO[18]) U21.2(K)
GPIO19: U7.23(IOPAD_GPIO[19])
GPIO20: C61.2 R32.2 U7.18(IOPAD_GPIO[20])
GPIO21: U2.2(K) U7.21(IOPAD_GPIO[[21])
GPIO22: C60.2 R29.2 U7.22(IOPAD_GPIO[[22])
HGND: C54.1 C55.1 C56.1 C57.2 C58.1 C62.2 C63.1 C64.2 C65.1 D12.1(A) D19.2(A) D20.2(A) D22.2(A) D24.2(A) D26.2(A) R22.1 U7.29(HVSS3) U7.35(HVSS3) U7.36(HVSSESD) U7.49(HVSSESD) U7.65(EP) U13.3(EMIT) U15.3(EMIT)
HVDD: C55.2 C56.2 D18.1(K) D20.1(C) D21.1(K) D23.1(K) D25.1(K) H8.2 U7.30(HVDD)
LED_BLUE: R11.1 U1.14(P0.11)
NNC_32K_IN: C46.2 U7.9(LSE_INVINPAD) X4.2(OSC2)
NNC_32K_OUT: C48.2 U7.8(LSE_INVOUTPAD) X4.1(OSC1)
NNC_NRST: C59.1 R25.1 U1.29(P0.24) U7.24(IOPAD_NRST)
nRF_1V3: C7.2 L2.2 U1.46(DEC4)
RESET: C3.1 H2.4 R1.1 U1.24(P0.21/RESET)
SCL0: R10.1 U1.19(P0.16/TRACE1) U16.13(SCL) U17.1(SCL/SPC)
SCL1: U1.17(P0.14/TRACE3) U8.1
SCL2: U1.15(P0.12) U9.1
SCL3: U1.9(P0.07) U10.1
SCL4: U1.7(P0.05/AIN3) U11.1
SCL5: U1.5(P0.03/AIN1) U14.1
SDA0: R27.1 U1.18(P0.15/TRACE2) U16.14(SDA) U17.4(SDA/SDI/SDO)
SDA1: U1.16(P0.13) U8.2
SDA2: U1.10(P0.08) U9.2
SDA3: U1.8(P0.06) U10.2
SDA4: U1.6(P0.04/AIN2) U11.2
SDA5: U1.4(P0.02/AIN0) U14.2
SPI_CLK: H3.2 U1.37(P0.25) U7.1(IOPAD_GPIO[8])
SPI_CS: H3.5 U1.40(P0.28/AIN4) U7.4(IOPAD_GPIO[11])
SPI_MISO: H3.4 U1.39(P0.27) U7.3(IOPAD_GPIO[10])
SPI_MOSI: H3.3 U1.38(P0.26) U7.2(IOPAD_GPIO[9])
STIMU0: D17.1(C) R30.2 U7.34(STMU0) U15.1(A)
STIMU0': C64.1 D17.2(A) D23.2(A) D24.1(K) L11.1 R30.1 U15.2(C) U21.4(S)
STIMU0OUT: CN2.4 CN2.5 H9.1 L11.2 U21.3(S1)
STIMU1: C65.2 D25.2(A) D26.1(K) L12.1 U7.33(STMU1)
STIMU1OUT: CN2.6 CN2.7 H9.2 L12.2
STIMU2: D15.1(C) R26.2 U7.32(STMIU2) U13.1(A)
STIMU2': C62.1 D15.2(A) D18.2(A) D19.1(K) L9.1 R26.1 U2.4(S) U13.2(C)
STIMU2OUT: CN3.4 CN3.5 H9.3 L9.2 U2.3(S1)
STIMU3: C63.2 D21.2(A) D22.1(K) L10.1 U7.31(STMIU3)
STIMU3OUT: CN3.6 CN3.7 H9.4 L10.2
SW: D12.2(K) L8.2 U7.39(SW4) U7.40(SW4) U7.41(SW3) U7.42(SW3) U7.45(SW2) U7.46(SW2) U7.47(SW1) U7.48(SW1) U12.2
SWCLK: H1.3 U1.25(SWDCLK)
SWDIO: H1.2 U1.26(SWDIO)
SWO: H2.3 U1.21(P0.18/TRACEDATA[0]/SWO)
VBOOST: C54.2 H7.2 R18.2
VOUT: C28.2 D1.1(K) Q3.2(S) R13.2 R18.1 U18.1(VIN)
XTAL32MI: C12.2 U1.35(XC2) X2.3
XTAL32MO: C11.2 U1.34(XC1) X2.1
$1N12: C1.1 U1.1(DEC1)
$1N34: C4.1 U1.32(DEC2)
$1N36: C5.1 U1.33(DEC3)
$1N49: L1.1 U1.47(DCC)
$1N50: L1.2 L2.1
$1N61: R2.2 U5.1(/CHG)
$1N62: LED1.2(C) R2.1
$1N65: C13.2 SW1.3 U5.3(BAT)
$1N74: R3.1 U4.2(A)
$1N76: R5.1 U5.5(ISEN)
$1N86: C16.2 R4.1 R7.1 U6.5(OUT)
$1N87: R4.2 R6.2 U6.4(FB)
$1N289: C22.2 U17.5(C1)
$1N316: R13.1 U18.3(EN)
$1N322: R14.1 U19.1(STAT)
$1N324: LED2.2(C) R14.2
$1N330: R15.1 U19.5(PROG)
$1N352: LED3.2(A) R11.2
$1N356: C34.2 L3.1 U1.30(ANT)
$1N358: C35.2 C36.2 L3.2 RF1.1
$2N24: R28.1 R29.1 U13.4(COL)
$2N25: R31.1 R32.1 U15.4(COL)
$2N55: H7.3 L8.1
$2N56: H7.1 U12.1
$2N69: C51.2 U7.57(DIG_LD0)
$2N72: C47.2 C49.1 U7.54(VBG)
$2N133: C32.1 U20.10(V3)
$2N137: R19.1 U20.9(RXD)
$2N139: R20.1 U20.8(TXD)
$2N157: R33.1 U21.1(A)
$2N160: R34.1 U2.1(A)

Not connected (* = marked no-connect by the designer): CN2 2 3; CN3 2 3; H2 2*; U1 11(P0.09/NFC1) 12(P0.10/NFC2) 20(P0.17) 27(P0.22)* 44(NC)*; U3 4(NC/ADJ)*; U7 52(EX_MOS1)* 53(EX_MOS2)* 61(IOPAD_GPIO[0]) 62(IOPAD_GPIO[1]) 63(IOPAD_GPIO[2]) 64(IOPAD_GPIO[5]); U16 4(INT1)* 9(INT2)* 10(NC)* 11(NC)*; U17 2(NC)* 7(INT/DRDY/SDO)* 11(NC)* 12(NC)*; U18 4(NC)*; U20 4(RTS#)* 5(CTS#)* 6(TNOW)*; USB1 A5(CC1)* B5(CC2)*; USB2 A5(CC1)* A8(SBU1)* B5(CC2)* B8(SBU2)*

## Notes on the sheets
sheet 1
- AP2112K-3.3TRG1
- AP2127K-1.8TRG1
- VDDLDO
- 1V8LDO
- 电池充电
- 电池电量检测
- 电池插座
- TYPE-C输入
- 主控板
- 指示灯
- 腕部磁力计
- 调试接口
- 外部低速晶振
- 外部高速晶振
- 外部电源控制
- 腕部IMU
- 连接手指
- 滤波电容
- 参考设计
- VDDLDO
- 充电管理
- TYPE-C输入
sheet 2
- VBAT这里不太确定
- 使用内部MOS
- 功率电感：TMAX-1365-101-M
- 串口转USB
- 电极防脱落
- 电刺激芯片
- 外部低速晶振
- BOOT
- VBOOST
- 电刺激输出
- 控制HVDD
- ESD保护
- 脱落时切断输出
- 地分割
- 引出SPI,UART
